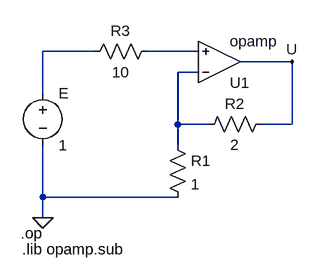
[diagram p0: schematic DC_wzm_op_ide.asc]
DC_wzm_op_ide.asc, the LTspice schematic file:
Version 4
SHEET 1 880 680
WIRE 16 32 -64 32
WIRE 176 32 96 32
WIRE 320 48 240 48
WIRE 176 64 144 64
WIRE -64 96 -64 32
WIRE 144 144 144 64
WIRE 192 144 144 144
WIRE 320 144 320 48
WIRE 320 144 272 144
WIRE 144 176 144 144
WIRE -64 256 -64 176
WIRE 144 256 -64 256
WIRE -64 288 -64 256
FLAG 320 48 U
FLAG -64 288 0
SYMBOL res 128 160 R0
SYMATTR InstName R1
SYMATTR Value 1
SYMBOL res 288 128 R90
WINDOW 0 0 56 VBottom 2
WINDOW 3 32 56 VTop 2
SYMATTR InstName R2
SYMATTR Value 2
SYMBOL res 112 16 R90
WINDOW 0 0 56 VBottom 2
WINDOW 3 32 56 VTop 2
SYMATTR InstName R3
SYMATTR Value 10
SYMBOL voltage -64 80 R0
WINDOW 123 0 0 Left 0
WINDOW 39 0 0 Left 0
SYMATTR InstName E
SYMATTR Value 1
SYMBOL Opamps\\opamp 208 112 M180
SYMATTR InstName U1
TEXT -98 312 Left 2 !.op
TEXT -96 336 Left 2 !.lib opamp.sub

The netlist it stands for:
* DC_wzm_op_ide.asc
R1 N003 0 1
R2 U N003 2
R3 N002 N001 10
V§E N001 0 1
XU1 N003 N002 U opamp Aol=100K GBW=10Meg  ; pins invin noninvin out
.op
.lib opamp.sub
.backanno
.end